# Altium schematic sheet Power-Sheet.SchDoc (part 1 of 3)
size 420 x 297 mm; SheetNumber: 2; SheetTotal: 5
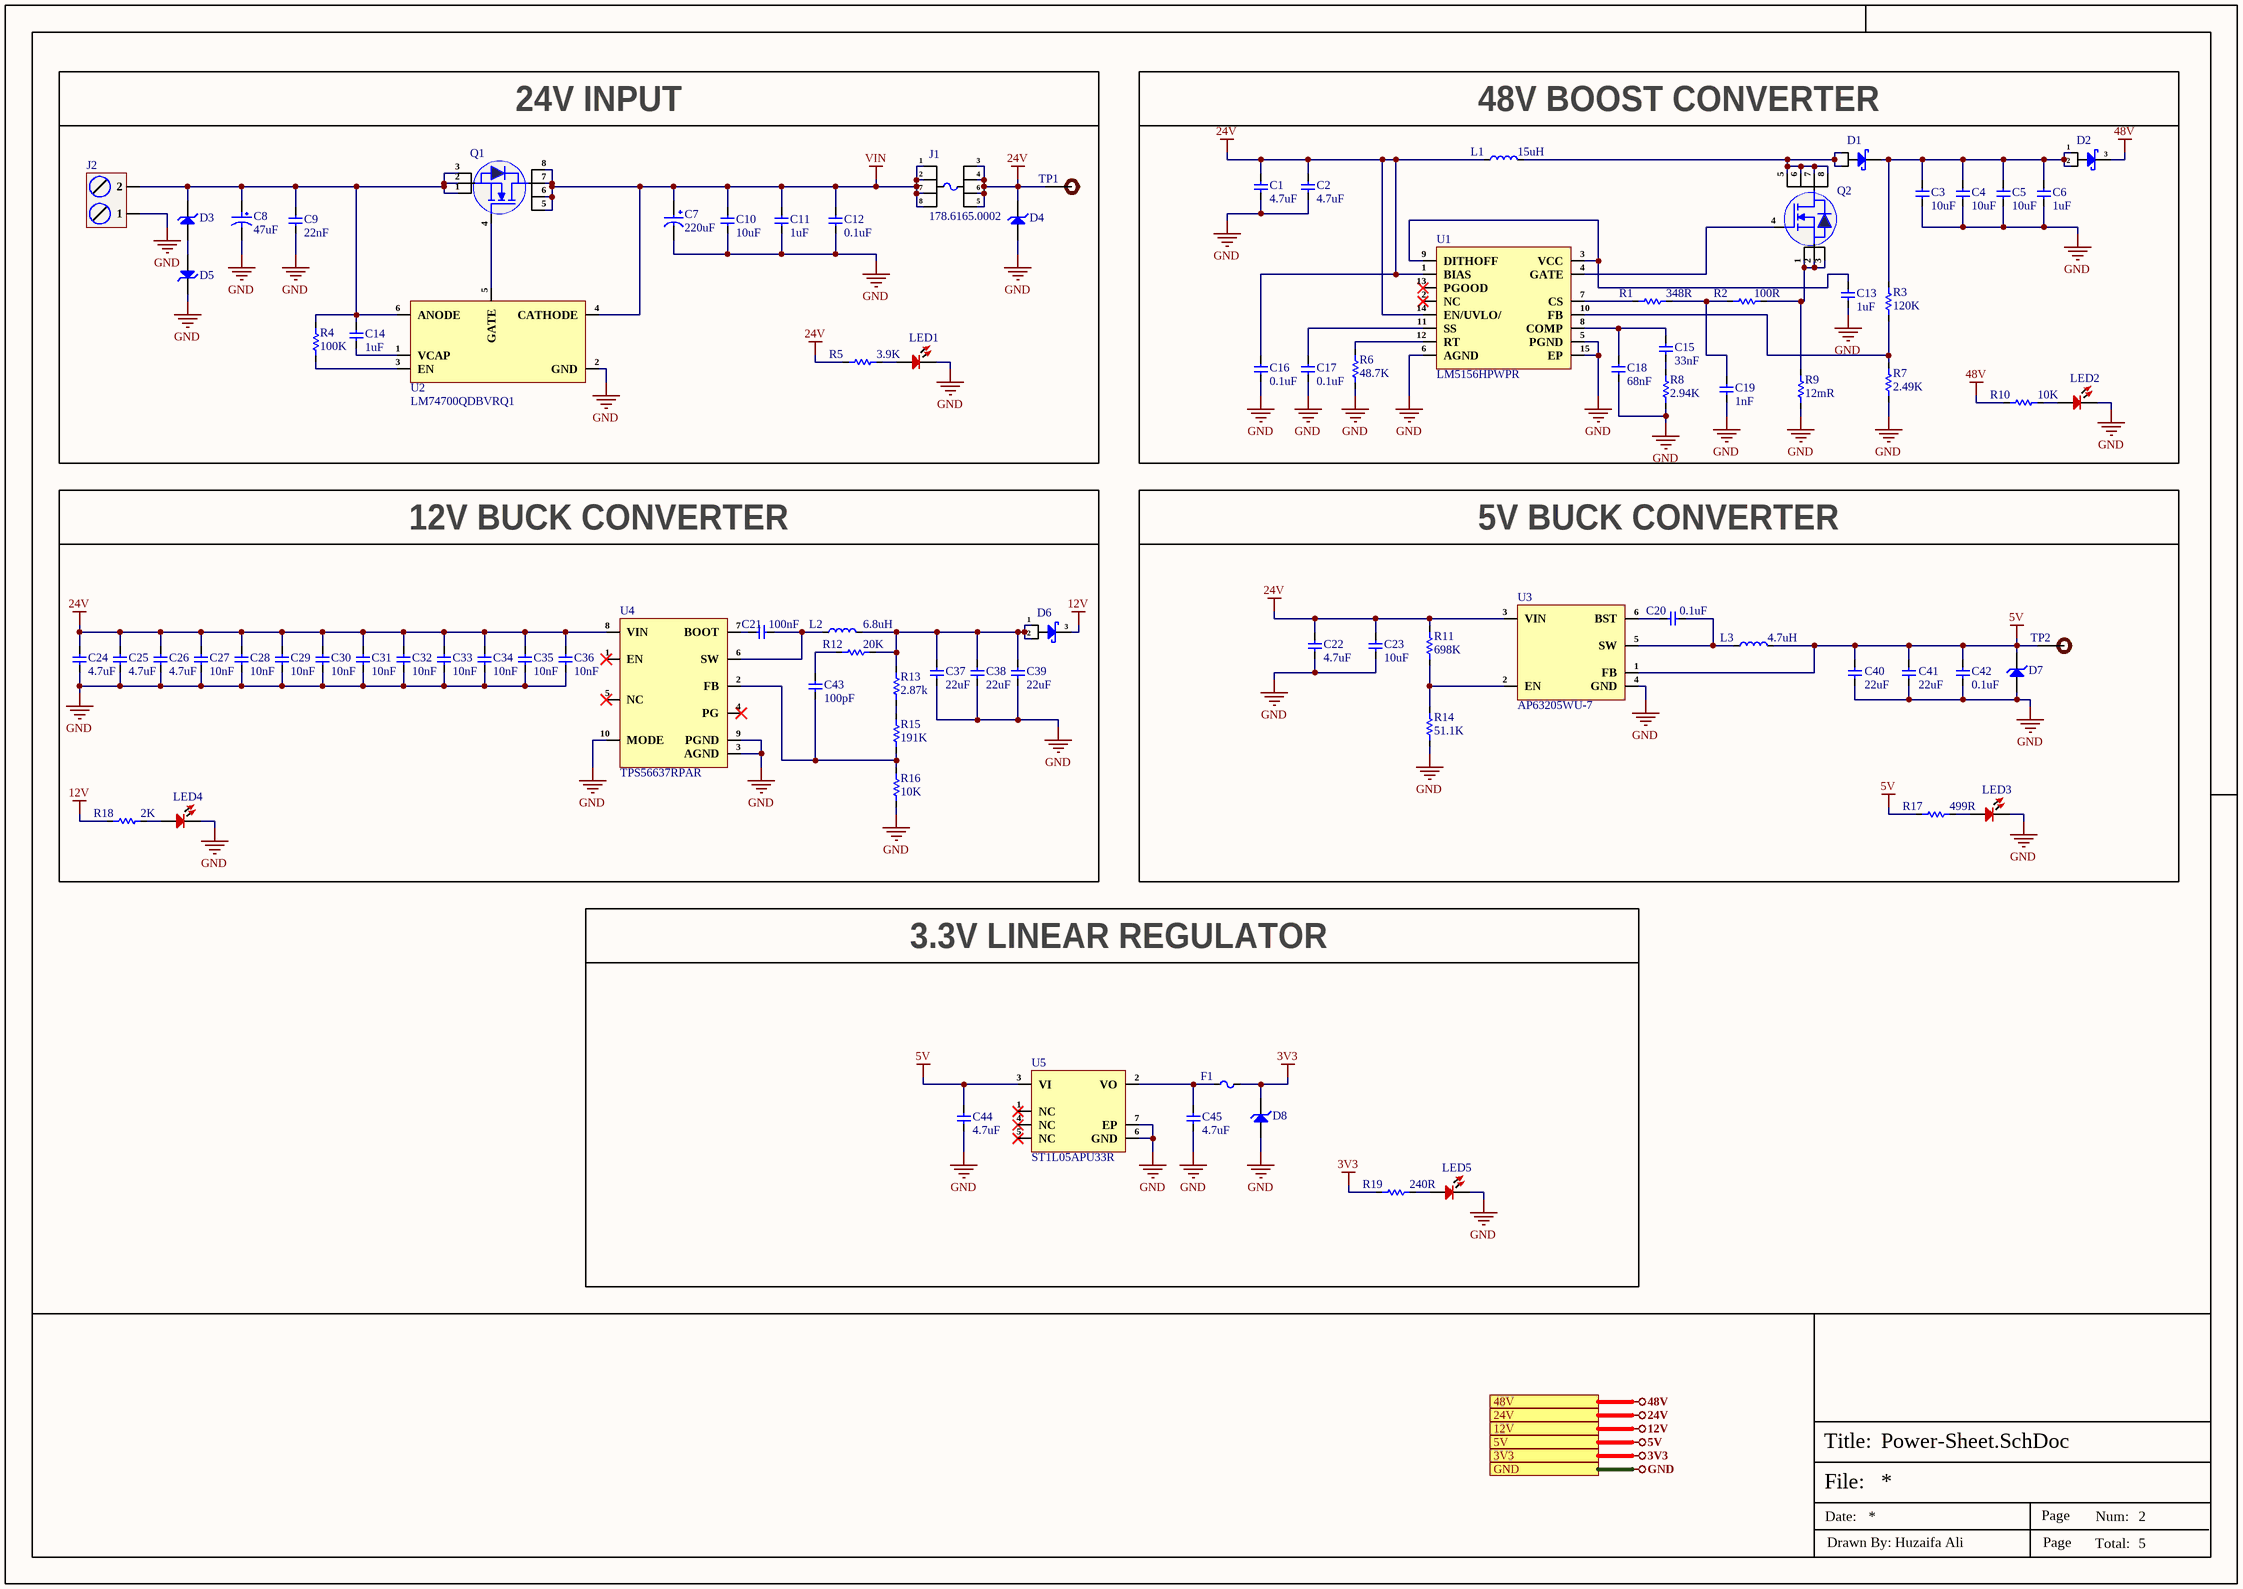
[diagram p0: Power-Sheet.SchDoc]

## Parts
C1  4.7uF  [Cap-1206]
C2  4.7uF  [Cap-1206]
C3  10uF  [Cap-1210]
C4  10uF  [Cap-1210]
C5  10uF  [Cap-1210]
C6  1uF  [Cap-1206]
C7  220uF  [UCD-220uF-10mmDia]
C8  47uF  [RVT1H470M0607]
C9  22nF  [Cap-0805]
C10  10uF  [Cap-0805]
C11  1uF  [Cap-0603]
C12  0.1uF  [Cap-0603]
C13  1uF  [Cap-0402]
C14  1uF  [Cap-0603]
C15  33nF  [Cap-0402]
C16  0.1uF  [Cap-0603]
C17  0.1uF  [Cap-0402]
C18  68nF  [Cap-0402]
C19  1nF  [Cap-0402]
C20  0.1uF  [Cap-0603]
C21  100nF  [Cap-0603]
C22  4.7uF  [Cap-1206]
C23  10uF  [Cap-0805]
C24  4.7uF  [Cap-1206]
C25  4.7uF  [Cap-1206]
C26  4.7uF  [Cap-1206]
C27  10nF  [Cap-0402]
C28  10nF  [Cap-0402]
C29  10nF  [Cap-0402]
C30  10nF  [Cap-0402]
C31  10nF  [Cap-0402]
C32  10nF  [Cap-0402]
C33  10nF  [Cap-0402]
C34  10nF  [Cap-0402]
C35  10nF  [Cap-0402]
C36  10nF  [Cap-0402]
C37  22uF  [Cap-1210]
C38  22uF  [Cap-1210]
C39  22uF  [Cap-1210]
C40  22uF  [Cap-0805]
C41  22uF  [Cap-0805]
C42  0.1uF  [Cap-0603]
C43  100pF  [Cap-0402]
C44  4.7uF  [Cap-1206]
C45  4.7uF  [Cap-1206]
D1  STPS20M100SG-TR  [D2Pak.]  (value not drawn)
D2  V25PN60-M3/86A  [TO-277A]  (value not drawn)
D3  SMBJ58A-13-F  [SMB_]  (value not drawn)
D4  AZ4024-01G  [SOD-123]  (value not drawn)
D5  SMBJ26A-13-F  [SMB_]  (value not drawn)
D6  V25PN60-M3/86A  [TO-277A]  (value not drawn)
D7  AZ3005-01G  [SOD-123]  (value not drawn)
D8  AZ3003-01G  [SOD-123]  (value not drawn)
F1  0805L110SLYR  [Fuse-0805]  (value not drawn)
J1  178.6165.0002  [178.6165.0002]
J2  DB128L-5.08-2P-OG-S  [DB128L-5.08-2P-OG-S]  (value not drawn)
L1  15uH  [FEXL1010A-150M]
L2  6.8uH  [MWSA1206S-6R8MT]
L3  4.7uH  [YPRH0703-4R7M]
LED1  RED  [LED-0603]  (value not drawn)
LED2  RED  [LED-0603]  (value not drawn)
LED3  RED  [LED-0603]  (value not drawn)
LED4  RED  [LED-0603]  (value not drawn)
LED5  RED  [LED-0603]  (value not drawn)
Q1  CSD18531Q5A  [8-VSONP (5x6)]  (value not drawn)
Q2  CSD19537Q3  [8-VSON-CLIP (3.3x3.3)]  (value not drawn)
R1  348R  [Res-0402]
R2  100R  [Res-0402]
R3  120K  [Res-0402]
R4  100K  [Res-0402]
R5  3.9K  [Res-0402]
R6  48.7K  [Res-0603]
R7  2.49K  [Res-0402]
R8  2.94K  [Res-0402]
R9  12mR  [RES-2512]
R10  10K  [Res-0402]
R11  698K  [RES-0805]
R12  20K  [Res-0402]
R13  2.87k  [Res-0402]
R14  51.1K  [RES-0805]
R15  191K  [Res-0402]
R16  10K  [Res-0402]
R17  499R  [Res-0402]
R18  2K  [Res-0402]
R19  240R  [Res-0402]
TP1  TEST POINT  [Test-point]  (value not drawn)  (no BOM)
TP2  TEST POINT  [Test-point]  (value not drawn)  (no BOM)
U1  LM5156HPWPR  [HTSSOP-14-EP]
U2  LM74700QDBVRQ1  [SOT-23-6]
U3  AP63205WU-7  [TSOT-23-6]
U4  TPS56637RPAR  [10-VQFN-HR (3x3)]
U5  ST1L05APU33R  [DFN-6(3x3)]

## Blocks framed on the sheet
24V INPUT: C7-C12 C14 D3-D5 J1 J2 LED1 Q1 R4 R5 TP1 U2
48V BOOST CONVERTER: C1-C6 C13 C15-C19 D1 D2 L1 LED2 Q2 R1-R3 R6-R10 U1
12V BUCK CONVERTER: C21 C24-C39 C43 D6 L2 LED4 R12 R13 R15 R16 R18 U4
5V BUCK CONVERTER: C20 C22 C23 C40-C42 D7 L3 LED3 R11 R14 R17 TP2 U3
3.3V LINEAR REGULATOR: C44 C45 D8 F1 LED5 R19 U5

## Ports
3V3 (see Top-Sheet[2B], Comms-Sheet[4D], Controller-Sheet[4D]), 5V (see Top-Sheet[2B], Comms-Sheet[4D], Controller-Sheet[4D]), 12V (see Top-Sheet[2B], Relay-Sheet[4D]), 24V (see Top-Sheet[2B], Relay-Sheet[4D]), 48V (see Top-Sheet[2B], Relay-Sheet[4D]), GND (see Top-Sheet[2B], Comms-Sheet[4D], Controller-Sheet[4D], Relay-Sheet[4D])

## Nets
3V3: D8.2(K) F1.2 R19.1 ; port 3V3
5V: C40.2 C41.2 C42.2 C44.2 D7.2(K) L3.2 R17.1 TP2.1 U3.1(FB) U5.3(VI) ; port 5V
12V: D6.3(K) R18.1 ; port 12V
24V: C1.2 C2.2 C16.2 C22.2 C23.2 C24.2 C25.2 C26.2 C27.2 C28.2 C29.2 C30.2 C31.2 C32.2 C33.2 C34.2 C35.2 C36.2 D4.2(K) J1.3 J1.4 J1.5 J1.6 L1.1 R5.1 R11.2 TP1.1 U1.1(BIAS) U1.14(EN/UVLO/) U3.3(VIN) U4.8(VIN) ; port 24V
48V: D2.3(K) R10.1 ; port 48V
GND: C1.1 C2.1 C3.1 C4.1 C5.1 C6.1 C7.2 C8.2 C9.1 C10.1 C11.1 C12.1 C13.1 C16.1 C17.1 C18.1 C19.1 C22.1 C23.1 C24.1 C25.1 C26.1 C27.1 C28.1 C29.1 C30.1 C31.1 C32.1 C33.1 C34.1 C35.1 C36.1 C37.1 C38.1 C39.1 C40.1 C41.1 C42.1 C44.1 C45.1 D4.1(A) D5.2(K) D7.1(A) D8.1(A) J2.1 LED1.2 LED2.2 LED3.2 LED4.2 LED5.2 R6.1 R7.1 R8.1 R9.1 R14.1 R16.1 U1.5(PGND) U1.6(AGND) U1.15(EP) U2.2(GND) U3.4(GND) U4.3(AGND) U4.9(PGND) U4.10(MODE) U5.6(GND) U5.7(EP) ; port GND
VIN: C7.1 C10.2 C11.2 C12.2 J1.1 J1.2 J1.7 J1.8 Q1.5(D) Q1.6(D) Q1.7(D) Q1.8(D) U2.4(CATHODE)
NetC3_2: C3.2 C4.2 C5.2 C6.2 D1.3(K) D2.1(A) D2.2(A) R3.2
NetC8_1: C8.1 C9.2 C14.2 D3.2(K) J2.2 Q1.1(S) Q1.2(S) Q1.3(S) R4.1 U2.6(ANODE)
NetC13_2: C13.2 U1.3(VCC) U1.9(DITHOFF)
NetC14_1: C14.1 U2.1(VCAP)
NetC15_1: C15.1 R8.2
NetC15_2: C15.2 C18.2 U1.8(COMP)
NetC17_2: C17.2 U1.11(SS)
NetC19_2: C19.2 R1.2 R2.1
NetC20_1: C20.1 L3.1 U3.5(SW)
NetC20_2: C20.2 U3.6(BST)
NetC21_1: C21.1 L2.1 U4.6(SW)
NetC21_2: C21.2 U4.7(BOOT)
NetC37_2: C37.2 C38.2 C39.2 D6.1(A) D6.2(A) L2.2 R12.2 R13.2
NetC43_1: C43.1 R15.1 R16.2 U4.2(FB)
NetC43_2: C43.2 R12.1
NetC45_2: C45.2 F1.1 U5.2(VO)
NetD1_1: D1.1(A) D1.2(A) L1.2 Q2.5(D) Q2.6(D) Q2.7(D) Q2.8(D)
NetD3_1: D3.1(A) D5.1(A)
NetLED1_1: LED1.1 R5.2
NetLED2_1: LED2.1 R10.2
NetLED3_1: LED3.1 R17.2
NetLED4_1: LED4.1 R18.2
NetLED5_1: LED5.1 R19.2
NetQ1_4: Q1.4(G) U2.5(GATE)
NetQ2_1: Q2.1(S) Q2.2(S) Q2.3(S) R2.2 R9.2
NetQ2_4: Q2.4(G) U1.4(GATE)
NetR1_1: R1.1 U1.7(CS)
NetR3_1: R3.1 R7.2 U1.10(FB)
NetR4_2: R4.2 U2.3(EN)
NetR6_2: R6.2 U1.12(RT)
NetR11_1: R11.1 R14.2 U3.2(EN)
NetR13_1: R13.1 R15.2

Not connected (* = marked no-connect by the designer): U1 2(NC)* 13(PGOOD)*; U4 1(EN)* 4(PG)* 5(NC)*; U5 1(NC)* 4(NC)* 5(NC)*

## Notes on the sheet
- File:
- Title:
- Date:
- Page
- Num:
- Total:
- Drawn By: Huzaifa Ali